# Altium schematic sheet Timing.SchDoc
size A4
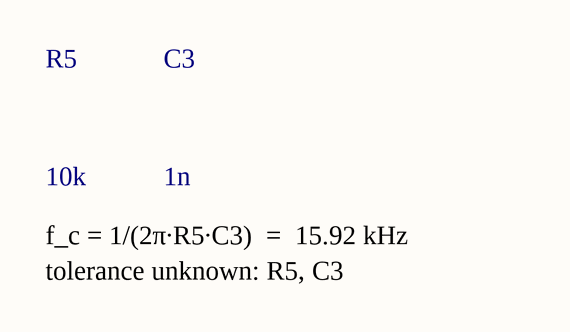
[diagram p0: Timing.SchDoc]

## Parts
C3  1n
R5  10k

## Notes on the sheet
- f_c = 1/(2π·R5·C3)  =  15.92 kHz
- tolerance unknown: R5, C3

## Library data of the parts
C3 = Capacitor
R5 = Resistor